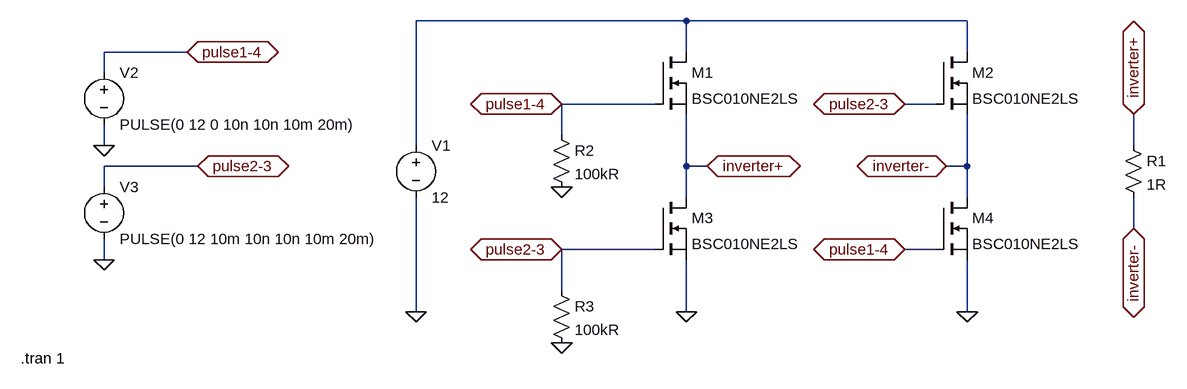
[diagram p0: schematic inverter.asc]
inverter.asc, the LTspice schematic file:
Version 4.1
SHEET 1 1064 680
WIRE 208 80 -208 80
WIRE 640 80 208 80
WIRE -560 128 -688 128
WIRE -688 160 -688 128
WIRE 208 128 208 80
WIRE 640 128 640 80
WIRE 160 208 16 208
WIRE 592 208 544 208
WIRE 16 256 16 208
WIRE -688 272 -688 240
WIRE -208 272 -208 80
WIRE 896 272 896 224
WIRE -544 304 -688 304
WIRE 208 304 208 224
WIRE 240 304 208 304
WIRE 640 304 640 224
WIRE 640 304 608 304
WIRE -688 336 -688 304
WIRE 208 352 208 304
WIRE 640 352 640 304
WIRE 896 400 896 352
WIRE 160 432 16 432
WIRE 592 432 544 432
WIRE -688 448 -688 416
WIRE 16 496 16 432
WIRE -208 528 -208 352
WIRE 208 528 208 448
WIRE 640 528 640 448
FLAG 640 528 0
FLAG 208 528 0
FLAG -208 528 0
FLAG 16 336 0
FLAG 16 576 0
FLAG -560 128 pulse1-4
IOPIN -560 128 BiDir
FLAG -544 304 pulse2-3
IOPIN -544 304 BiDir
FLAG -688 448 0
FLAG -688 272 0
FLAG 16 208 pulse1-4
IOPIN 16 208 BiDir
FLAG 16 432 pulse2-3
IOPIN 16 432 BiDir
FLAG 544 432 pulse1-4
IOPIN 544 432 BiDir
FLAG 544 208 pulse2-3
IOPIN 544 208 BiDir
FLAG 240 304 inverter+
IOPIN 240 304 BiDir
FLAG 608 304 inverter-
IOPIN 608 304 BiDir
FLAG 896 224 inverter+
IOPIN 896 224 BiDir
FLAG 896 400 inverter-
IOPIN 896 400 BiDir
SYMBOL nmos 160 128 R0
SYMATTR InstName M1
SYMATTR Value BSC010NE2LS
SYMBOL nmos 592 128 R0
SYMATTR InstName M2
SYMATTR Value BSC010NE2LS
SYMBOL nmos 160 352 R0
SYMATTR InstName M3
SYMATTR Value BSC010NE2LS
SYMBOL nmos 592 352 R0
SYMATTR InstName M4
SYMATTR Value BSC010NE2LS
SYMBOL voltage -208 256 R0
WINDOW 123 0 0 Left 0
WINDOW 39 0 0 Left 0
SYMATTR InstName V1
SYMATTR Value 12
SYMBOL res 0 240 R0
SYMATTR InstName R2
SYMATTR Value 100kR
SYMBOL res 0 480 R0
SYMATTR InstName R3
SYMATTR Value 100kR
SYMBOL voltage -688 144 R0
WINDOW 123 0 0 Left 0
WINDOW 39 0 0 Left 0
SYMATTR InstName V2
SYMATTR Value PULSE(0 12 0 10n 10n 10m 20m)
SYMBOL voltage -688 320 R0
WINDOW 123 0 0 Left 0
WINDOW 39 0 0 Left 0
SYMATTR InstName V3
SYMATTR Value PULSE(0 12 10m 10n 10n 10m 20m)
SYMBOL res 880 256 R0
SYMATTR InstName R1
SYMATTR Value 1R
TEXT -816 600 Left 2 !.tran 1

The netlist it stands for:
* inverter.asc
M1 N001 pulse1-4 inverter+ inverter+ BSC010NE2LS
M2 N001 pulse2-3 inverter- inverter- BSC010NE2LS
M3 inverter+ pulse2-3 0 0 BSC010NE2LS
M4 inverter- pulse1-4 0 0 BSC010NE2LS
V1 N001 0 12
R2 pulse1-4 0 100kR
R3 pulse2-3 0 100kR
V2 pulse1-4 0 PULSE(0 12 0 10n 10n 10m 20m)
V3 pulse2-3 0 PULSE(0 12 10m 10n 10n 10m 20m)
R1 inverter+ inverter- 1R
.model NMOS NMOS
.model PMOS PMOS
.lib standard.mos
.tran 1
.backanno
.end